# Altium schematic sheet Main.SchDoc
size A4; SheetNumber: 1; SheetTotal: 5
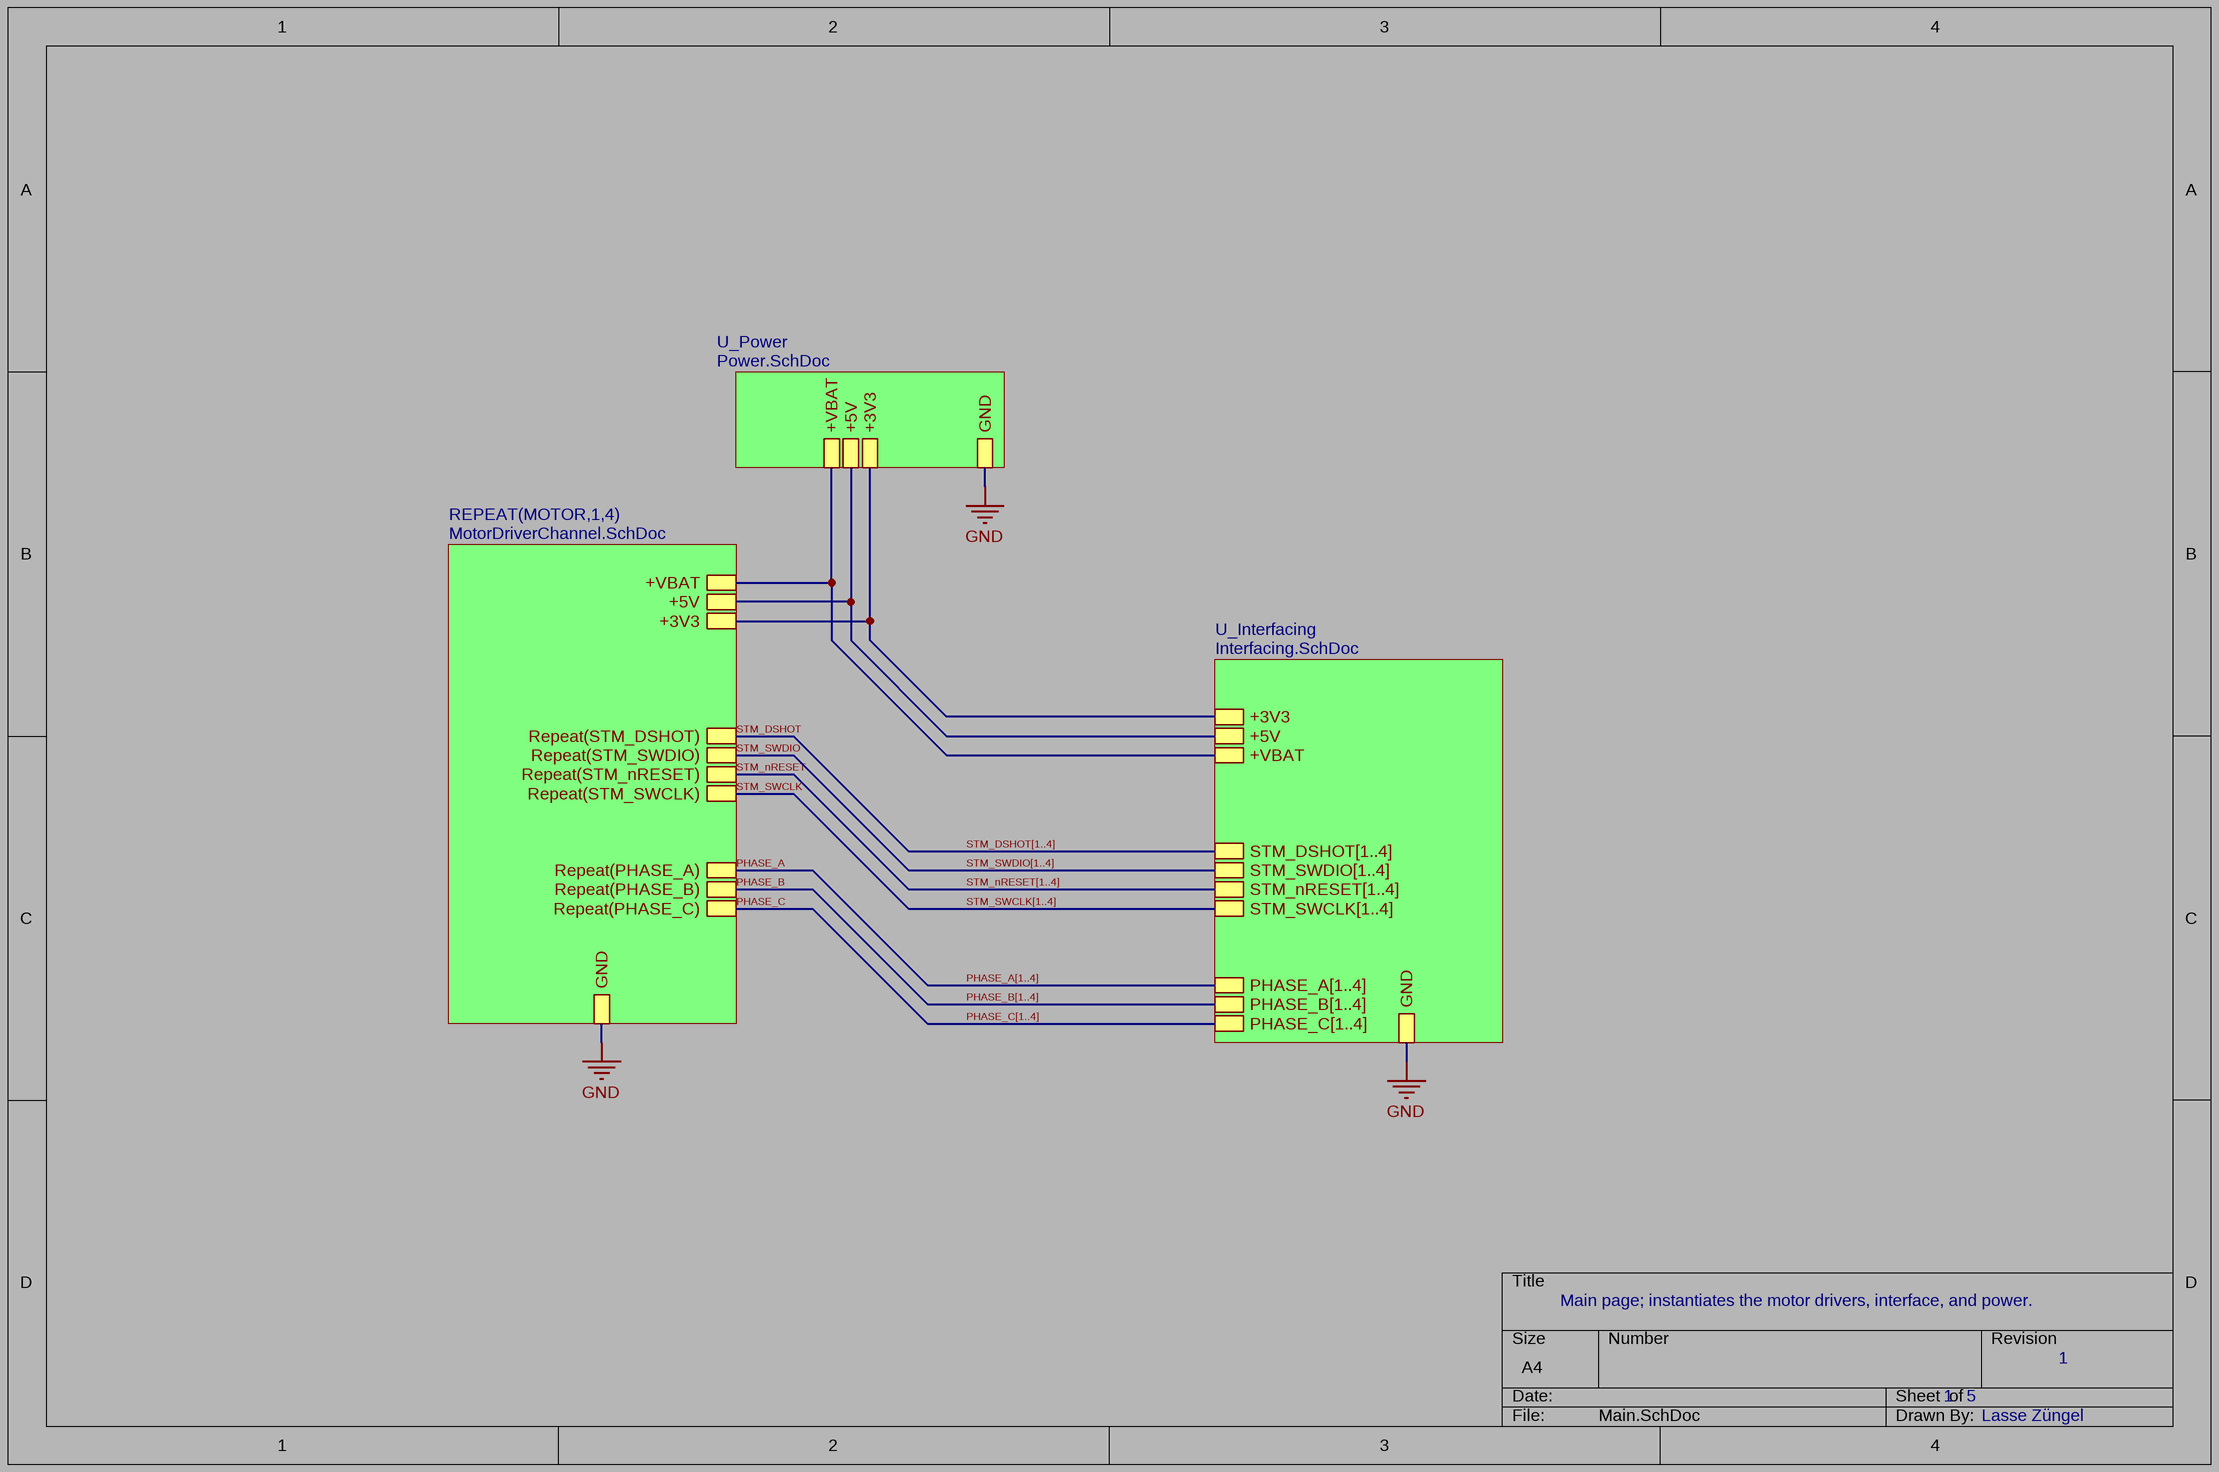
[diagram p0: Main.SchDoc]

## Sub-sheets
REPEAT(MOTOR,1,4) = MotorDriverChannel.SchDoc: +VBAT, +5V, +3V3, GND, Repeat(PHASE_A), Repeat(PHASE_B), Repeat(PHASE_C), Repeat(STM_SWDIO), Repeat(STM_nRESET), Repeat(STM_SWCLK), Repeat(STM_DSHOT)
U_Interfacing = Interfacing.SchDoc: +VBAT, STM_DSHOT[1..4], STM_SWDIO[1..4], STM_SWCLK[1..4], STM_nRESET[1..4], +3V3, +5V, GND, PHASE_A[1..4], PHASE_B[1..4], PHASE_C[1..4]
U_Power = Power.SchDoc: +VBAT, +5V, +3V3, GND

## Nets
GND: sheet REPEAT(MOTOR,1,4)/GND, sheet U_Power/GND, sheet U_Interfacing/GND
PHASE_A: sheet REPEAT(MOTOR,1,4)/Repeat(PHASE_A)
PHASE_B: sheet REPEAT(MOTOR,1,4)/Repeat(PHASE_B)
PHASE_C: sheet REPEAT(MOTOR,1,4)/Repeat(PHASE_C)
STM_DSHOT: sheet REPEAT(MOTOR,1,4)/Repeat(STM_DSHOT)
STM_nRESET: sheet REPEAT(MOTOR,1,4)/Repeat(STM_nRESET)
STM_SWCLK: sheet REPEAT(MOTOR,1,4)/Repeat(STM_SWCLK)
STM_SWDIO: sheet REPEAT(MOTOR,1,4)/Repeat(STM_SWDIO)
(unnamed): sheet REPEAT(MOTOR,1,4)/+VBAT, sheet U_Power/+VBAT, sheet U_Interfacing/+VBAT
(unnamed): sheet REPEAT(MOTOR,1,4)/+5V, sheet U_Power/+5V, sheet U_Interfacing/+5V
(unnamed): sheet REPEAT(MOTOR,1,4)/+3V3, sheet U_Power/+3V3, sheet U_Interfacing/+3V3

## Buses and harness runs
bus PHASE_A[1..4] = sheet U_Interfacing/PHASE_A[1..4]
bus PHASE_B[1..4] = sheet U_Interfacing/PHASE_B[1..4]
bus PHASE_C[1..4] = sheet U_Interfacing/PHASE_C[1..4]
bus STM_DSHOT[1..4] = sheet U_Interfacing/STM_DSHOT[1..4]
bus STM_nRESET[1..4] = sheet U_Interfacing/STM_nRESET[1..4]
bus STM_SWCLK[1..4] = sheet U_Interfacing/STM_SWCLK[1..4]
bus STM_SWDIO[1..4] = sheet U_Interfacing/STM_SWDIO[1..4]

## Notes on the sheet
- Main page; instantiates the motor drivers, interface, and power.
- 1   5
- 1
- Lasse Züngel